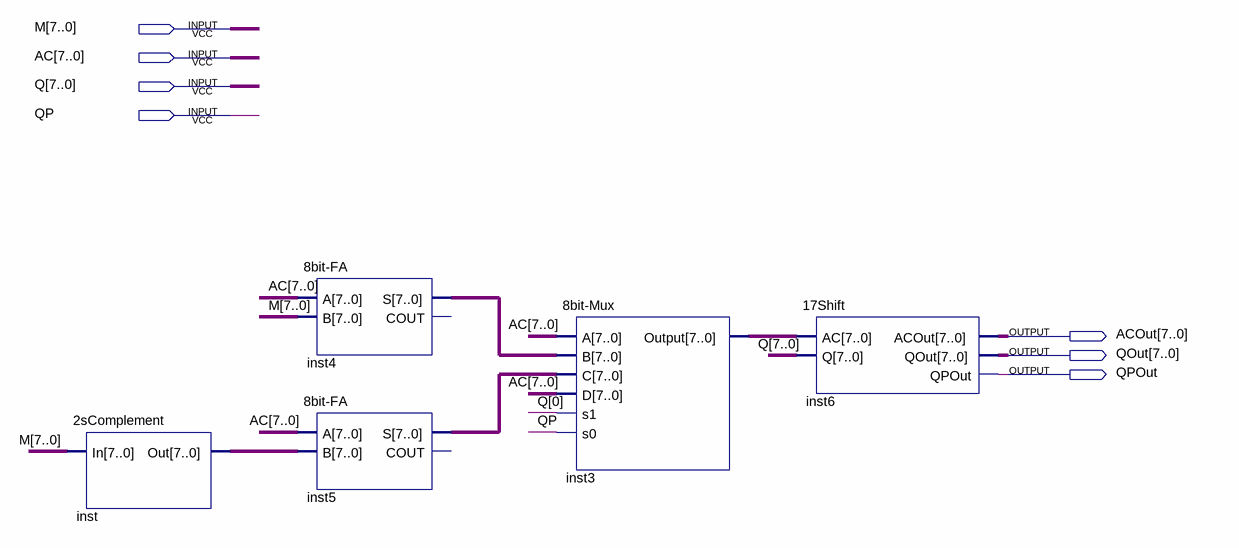
[diagram p0: schematic sheet]
// Quartus schematic MultPhase.bdf as structural Verilog: 5 symbols, 7 pins
module MultPhase (
  input  [7:0] M,
  input  [7:0] AC,
  input  [7:0] Q,
  input  QP,
  output [7:0] ACOut,
  output [7:0] QOut,
  output QPOut
);

  wire [7:0] inst3_output, inst4_s, inst5_s, inst_out;

  \2sComplement  inst (.In(M), .Out(inst_out));
  \8bit-FA  inst4 (.A(AC), .B(M), .S(inst4_s));  // open: COUT
  \8bit-FA  inst5 (.A(AC), .B(inst_out), .S(inst5_s));  // open: COUT
  \8bit-Mux  inst3 (.A(AC), .B(inst4_s), .C(inst5_s), .D(AC), .s1(Q[0]), .s0(QP), .Output(inst3_output));
  \17Shift  inst6 (.AC(inst3_output), .Q(Q), .ACOut(ACOut), .QOut(QOut), .QPOut(QPOut));
endmodule
